# EasyEDA Pro project 电脑鼠_数字量最终方案.eprj, board PCB2
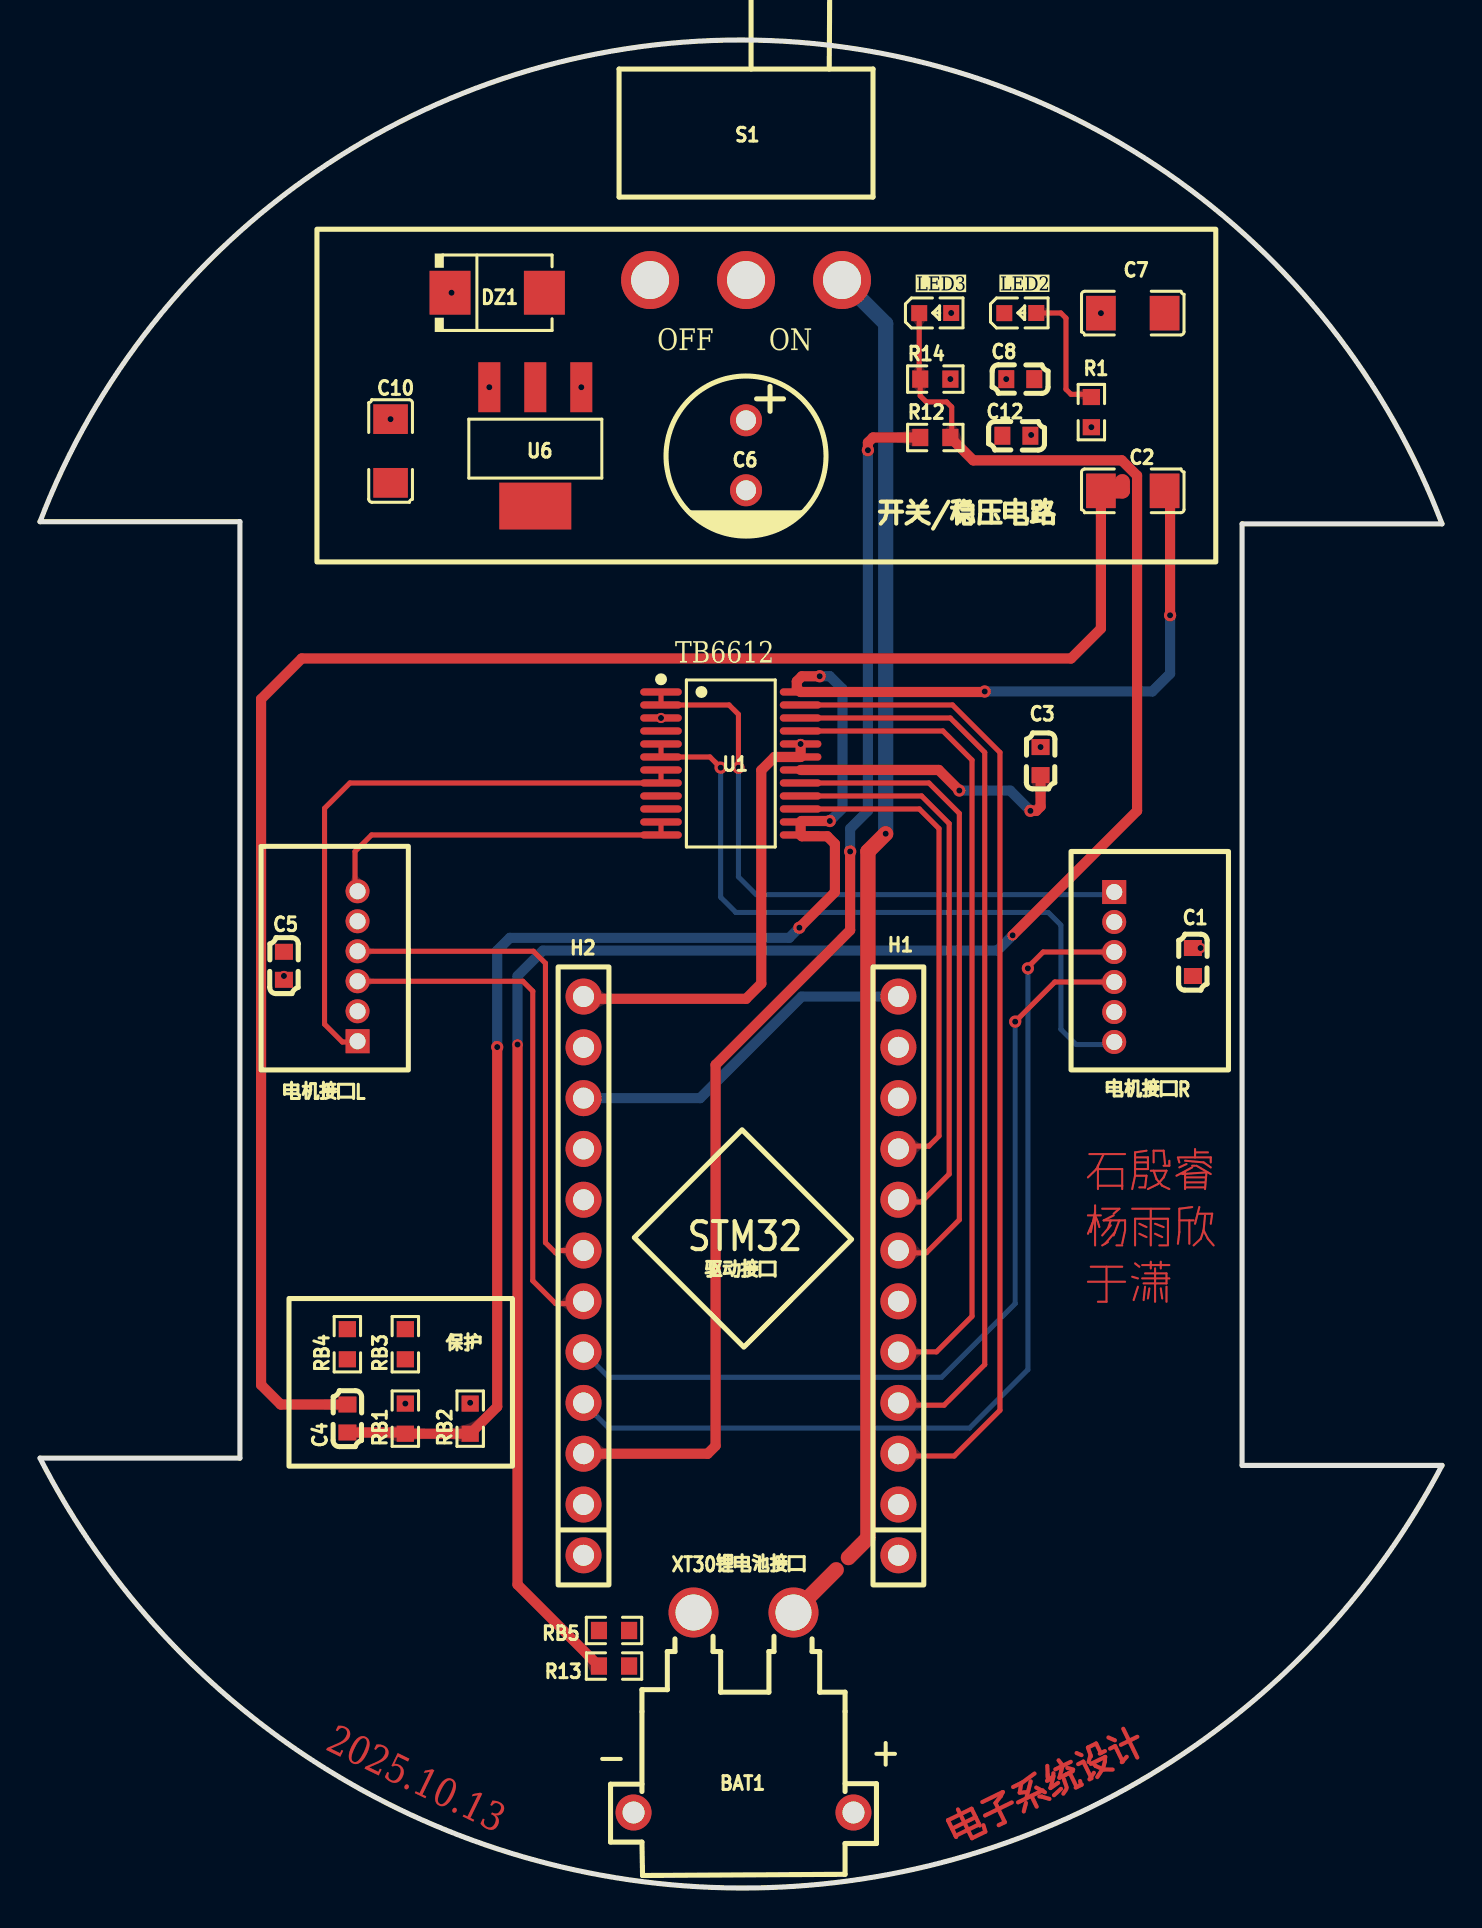
[diagram p4: board, top side]
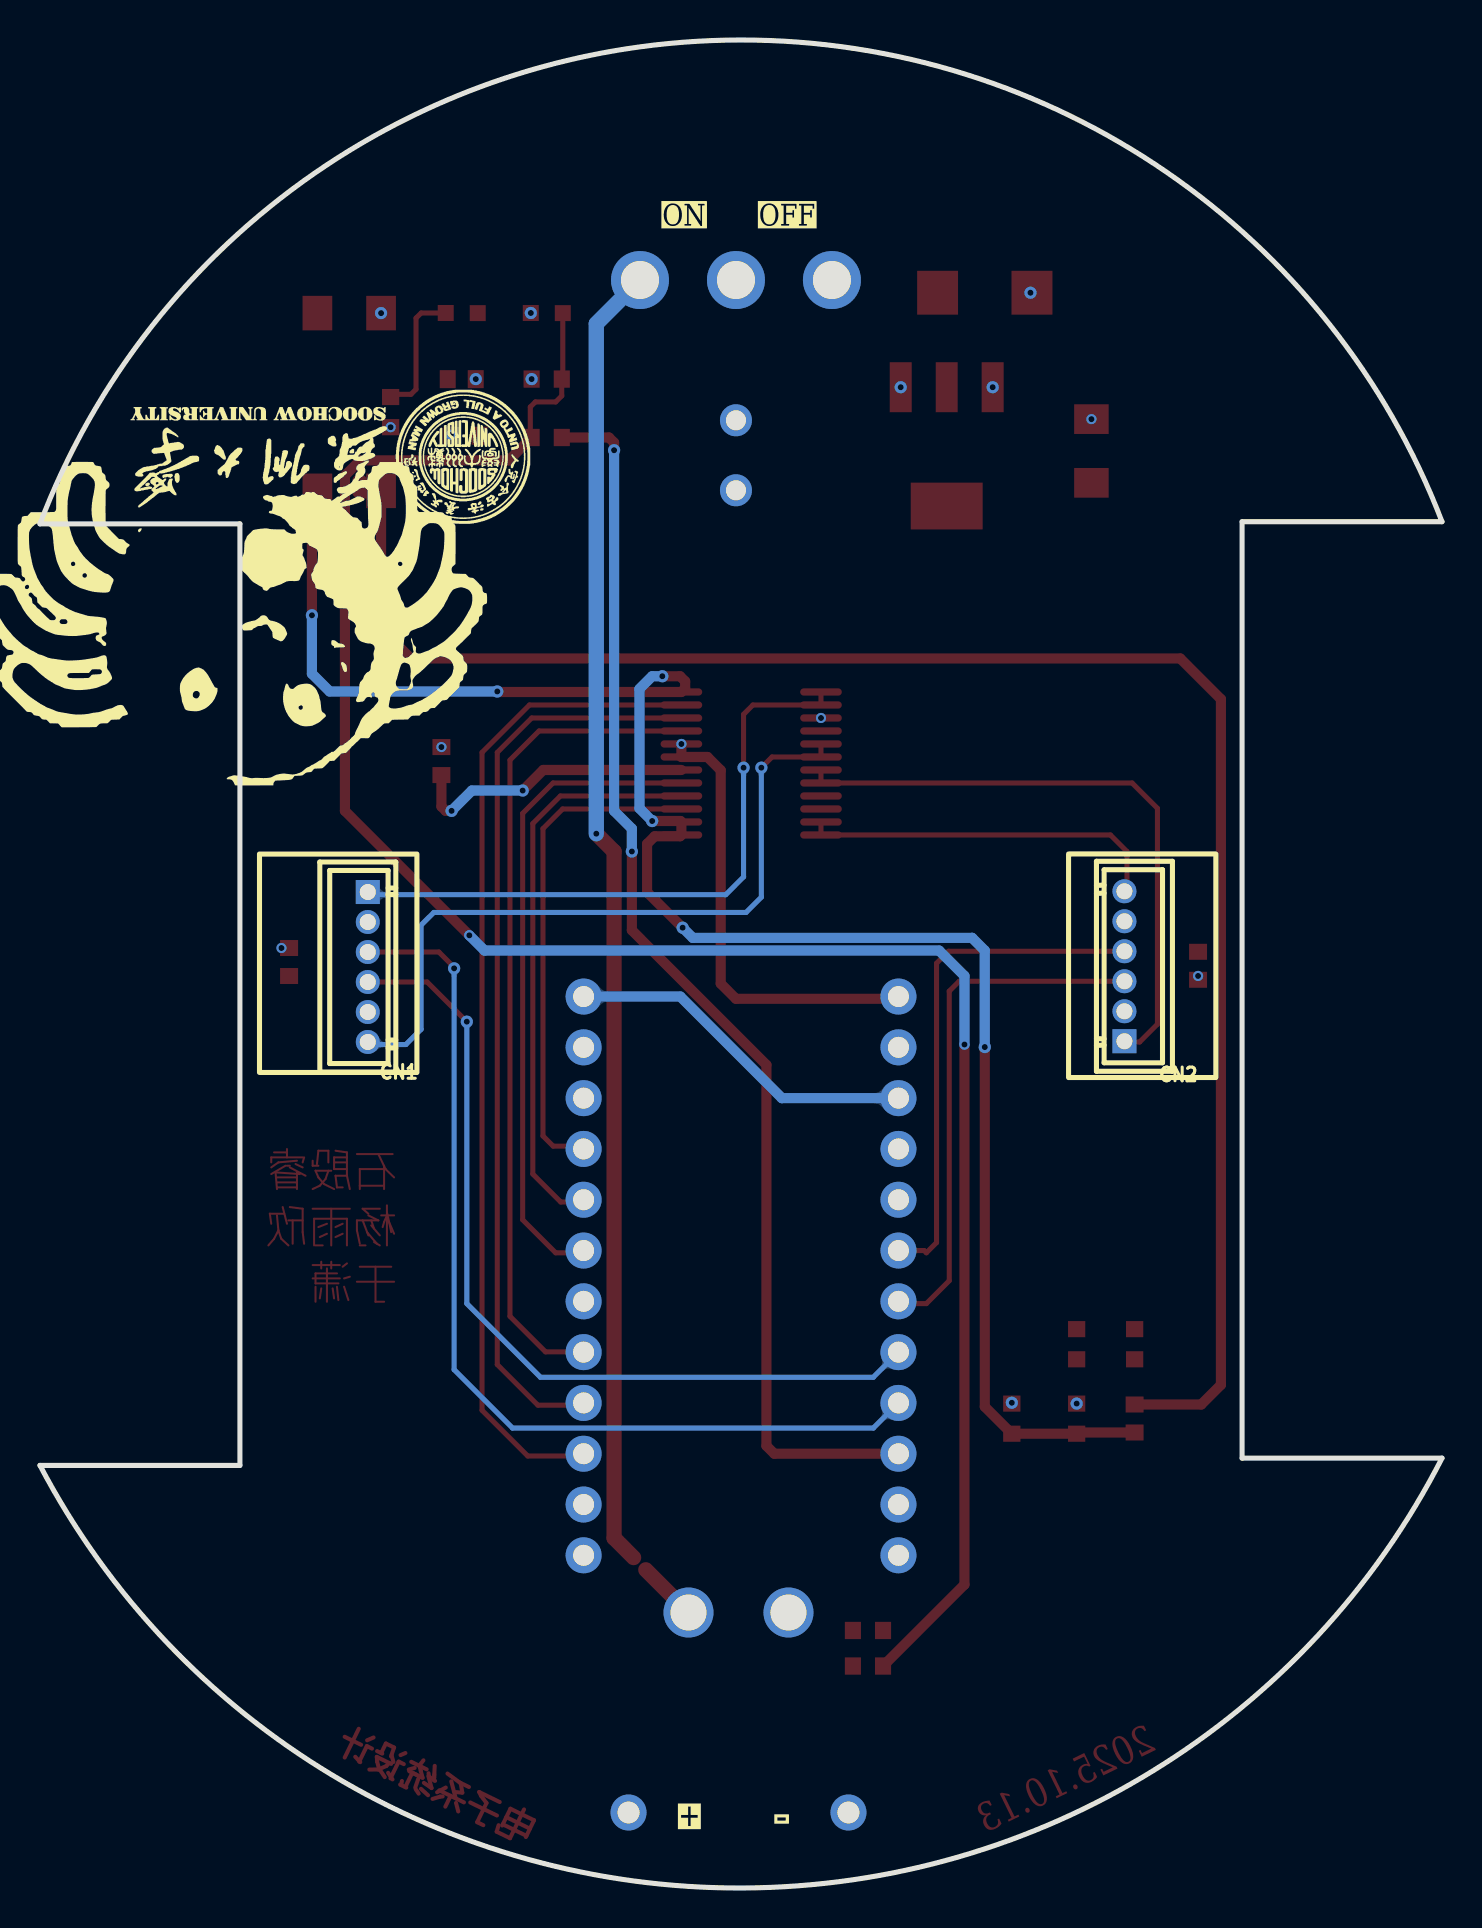
[diagram p5: board, bottom side, seen from below]

Outline 70.13 x 92.41 mm; copper layers: Top Layer, 7V4, +5V, Bottom Layer. Coordinates in mm from the lower left corner of the outline.
Outline path: 0,68.32 arc(35.1,92.41) 70.13,68.21 60.13,68.21 60.13,21.13 70.13,21.13 arc(34.95,0) 0,21.49 10,21.49 10,68.32 0,68.32
Stack: Top Layer 0.035mm 外层铜厚1oz / Dielectric1 0.2104mm 7628 RC49% 8.6mil / 7V4 0.0152mm 内层铜厚 / Dielectric2 1.065mm 1.1mm H/HOZ 含铜 / +5V 0.0152mm 内层铜厚 / Dielectric3 0.2104mm 7628 RC49% 8.6mil / Bottom Layer 0.035mm 外层铜厚1oz

## Design rules (mm)
template: JLCPCB Capability(Two Layers Board)
spacing copperThickness1oz (default): track to track 0.102, other pairs 0.152 to 0.3
spacing copperThickness2oz: track to track 0.203, other pairs 0.152 to 0.3
track width copperThickness1oz (default): min 0.127, default 0.254, max 2.54
track width copperThickness2oz: min 0.203, default 0.254, max 2.54
differential pair differentialPair (default): width min 0.127, default 0.254, max 2.54; gap min 0.152, default 0.152
via viaSize (default): diameter min 0.5, default 0.61, max 10; hole min 0.3, default 0.305, max 6.3

## Placement (name value [footprint] x y rotation side)
BAT1  XT30PW-M30.G.Y  [CONN-TH_XT30PW-M]  35.19 8.78 0 top
C1  100nF  [C0603]  57.67 46.3 90 top
C2  10uF  [C1206]  54.66 69.86 0 top
C3  100nF  [C0603]  50.05 56.35 270 top
C4  100nF  [C0603]  15.38 23.48 90 top
C5  100nF  [C0603]  12.2 46.11 270 top
C6  220uF  [CAP-TH_BD8.0-P3.50-D0.6-FD]  35.32 71.64 270 top
C7  10uF  [C1206]  54.66 78.75 180 top
C8  100nF  [C0603]  49.03 75.45 0 top
C10  10uF  [C1206]  17.54 71.86 90 top
C12  100nF  [C0603]  48.84 72.62 180 top
CN1  ZH1.5-6A  [CONN-TH_ZH1.5-6A]  53.73 46.05 270 bottom
CN2  ZH1.5-6A  [CONN-TH_ZH1.5-6A]  15.88 46.09 90 bottom
DZ1  SK106B  [SMB_L4.5-W3.7-LS5.4-RD]  22.87 79.77 0 top
H1  KH-2.54FH-1X12P-H8.5  [HDR-TH_12P-P2.54-V-F]  42.94 30.61 90 top
H2  KH-2.54FH-1X12P-H8.5  [HDR-TH_12P-P2.54-V-F]  27.19 30.61 90 top
LED2  XL-1608SURC-06  [LED0603-RD_RED]  49.03 78.75 0 top
LED3  XL-1608SURC-06  [LED0603-RD_RED]  44.78 78.75 0 top
R1  1kΩ  [R0603]  52.59 73.8 90 top
R12  2kΩ  [R0603]  44.78 72.53 0 top
R13  10kΩ  [R0603]  28.71 11.1 180 top
R14  null  [R0603]  44.78 75.45 0 top
RB1  0Ω  [R0603]  18.27 23.47 90 top
RB2  0Ω  [R0603]  21.52 23.47 90 top
RB3  0Ω  [R0603]  18.27 27.19 90 top
RB4  0Ω  [R0603]  15.37 27.19 90 top
RB5  0Ω  [R0603]  28.71 12.88 0 top
S1  SS12D10G5-WJ  [SW-TH_3P-SS12D06-1]  35.32 80.4 180 top
U1  TB6612FNG(O,C,8,EL  [SSOP-24_L8.4-W5.8-P0.65-LS7.8-BL]  34.55 56.23 270 top
U6  LM39100S-5.0  [SOT-223-3_L6.5-W3.4-P2.30-LS7.0-BR]  24.77 72.07 90 top

## Footprints (pads in the part's own frame, mm; a bottom-side part is the same pattern mirrored in y, then rotated)
C0603
  rect 0.8x0.9 smd: 1(-0.7,0) 2(0.7,0)
C1206
  rect 1.485x1.728 smd: 1(-1.593,0) 2(1.593,0)
CAP-TH_BD8.0-P3.50-D0.6-FD
  round 1.6 hole 1: 1(-1.75,0) 2(1.75,0)
CONN-TH_XT30PW-M
  round 2.5 hole 1.8: 1(-2.5,5) 2(2.5,5)
  round 1.8 hole 1.1: 3(5.5,-5) 4(-5.5,-5)
CONN-TH_ZH1.5-6A
  rect 1.2x1.2 hole 0.8: 1(-3.749,0)
  round 1.2 hole 0.8: 2(-2.251,0) 3(-0.75,0) 4(0.75,0) 5(2.251,0) 6(3.749,0)
HDR-TH_12P-P2.54-V-F
  round 1.8 hole 1.05: 1(-13.97,0) 2(-11.43,0) 3(-8.89,0) 4(-6.35,0) 5(-3.81,0) 6(-1.27,0) 7(1.27,0) 8(3.81,0) 9(6.35,0) 10(8.89,0) 11(11.43,0) 12(13.97,0)
LED0603-RD_RED
  rect 0.8x0.8 smd: 1(-0.799,-0.004) 2(0.799,0.004)
R0603
  rect 0.806x0.864 smd: 1(-0.753,0) 2(0.753,0)
SMB_L4.5-W3.7-LS5.4-RD
  rect 2.047x2.192 smd: 1(-2.361,0) 2(2.361,0)
SOT-223-3_L6.5-W3.4-P2.30-LS7.0-BR
  rect 2.5x1.1 smd: 1(2.97,-2.3) 2(2.97,0) 3(2.97,2.3)
  rect 2.34x3.6 smd: 4(-2.97,0)
SSOP-24_L8.4-W5.8-P0.65-LS7.8-BL
  oval 0.364x2.082 smd: 1(-3.575,-3.491) 2(-2.925,-3.491) 3(-2.275,-3.491) 4(-1.625,-3.491) 5(-0.975,-3.491) 6(-0.325,-3.491) 7(0.325,-3.491) 8(0.975,-3.491) 9(1.625,-3.491) 10(2.275,-3.491) 11(2.925,-3.491) 12(3.575,-3.491) 13(3.575,3.491) 14(2.925,3.491) 15(2.275,3.491) 16(1.625,3.491) 17(0.975,3.491) 18(0.325,3.491) 19(-0.325,3.491) 20(-0.975,3.491) 21(-1.625,3.491) 22(-2.275,3.491) 23(-2.925,3.491) 24(-3.575,3.491)
SW-TH_3P-SS12D06-1
  round 2.9 hole 1.9: 1(-4.8,0) 2(0,0) 3(4.8,0)

## Nets
As in the schematic, except:
GND: C1.1 C3.2 C5.1 C6.2 C7.1 C8.2 C10.1 C12.2 CN1.5 CN2.5 H1.1 H1.2 H1.6 H1.10 H1.11 H2.1 H2.2 H2.8 H2.9 LED2.1 RB3.1 RB3.2 RB4.1 RB4.2 RB5.1 U1.3 U1.4 U1.9 U1.10 U1.18 U6.2 U6.4
BGND: R13.1 RB5.2

Pads without a net: BAT1 1 2 3 4

## Via types
v1: diameter 0.61, hole 0.305, Top Layer to Bottom Layer, 24 vias
v2: diameter 0.508, hole 0.305, Top Layer to Bottom Layer, 10 vias

## Routing (per net, layer and track width the routed paths; a pad name or vN(x,y) marks a point on that pad's centre or on a via; arc(x,y) is an arc through that point)
3V3: length 17.9
  Bottom Layer w0.508: H1.12 38.1,44.58 33.02,39.5 H2.10
7V4: length 0
  Top Layer w0.508: v1(48.33,75.45) C8.1
  vias: v1(18.27,24.22) v1(20.58,79.77) v1(21.52,24.26) v1(27.07,75.04) v1(45.54,75.45) v1(45.58,78.76) v1(53.07,78.75)
+5V: length 22.9
  Top Layer w0.508: H2.12 27.3,44.46 35.32,44.46 36.08,45.22 36.08,55.89 36.74,56.55 U1.19 v2(38.04,57.2) ; v2(49.58,72.66) C12.1
  vias: v1(22.47,75.04) v2(12.2,45.61) v2(17.54,73.45) v2(50.05,57.05) v2(52.59,73.05) v2(58.05,47)
GND: length 14.5
  Top Layer w0.508: v1(45.98,54.88) 44.95,55.9 U1.18 ; C3.2 50.05,54.08 49.83,53.86 v1(49.54,53.86)
  Bottom Layer w0.508: v1(45.98,54.88) 48.52,54.88 v1(49.54,53.86)
  vias: v2(31.06,58.5)
PGND: length 90.9
  Top Layer w0.508: C4.2 12.04,24.18 11.06,25.16 11.06,59.45 13.09,61.48 51.57,61.48 53.07,62.97 C2.1
  Top Layer w0.762: 54.14,70.32 54.14,69.86 C2.1
(no net): length 3
  Top Layer w0.762: BAT1.2 39.82,15.91
BAT_ADC: length 62.8
  Top Layer w0.508: H2.3 33.4,21.72 33.79,22.11 33.79,41.16 40.52,47.89 v1(40.52,51.83) ; R12.1 41.67,72.53 41.41,72.28 v1(41.41,71.89)
  Bottom Layer w0.508: v1(41.41,71.89) 41.41,53.86 40.52,52.97 v1(40.52,51.83)
DIR_L1: length 41.4
  Top Layer w0.254: 42.94,26.8 42.95,26.81 44.84,26.81 46.62,28.59 46.62,56.4 45.16,57.85 U1.21
DIR_L2: length 45.7
  Top Layer w0.254: H1.4 43.05,24.14 45.22,24.14 47.25,26.17 47.25,56.78 45.53,58.5 U1.22
DIR_R1: length 32.7
  Top Layer w0.254: 42.94,31.88 43.05,31.76 44.33,31.76 45.98,33.41 45.98,53.73 44.46,55.25 U1.17
DIR_R2: length 28.7
  Top Layer w0.254: H1.8 43.05,34.3 44.08,34.3 45.48,35.7 45.48,53.23 44.1,54.6 U1.16
ENC_LA: length 43.5
  Top Layer w0.254: v1(48.78,43.32) 50.76,45.3 CN1.4
  Bottom Layer w0.254: 27.19,26.8 28.44,25.54 45.09,25.54 48.78,29.22 v1(48.78,43.32)
ENC_LB: length 48.7
  Top Layer w0.254: v1(49.41,45.99) 49.41,46.04 50.17,46.8 CN1.3
  Bottom Layer w0.254: v1(49.41,45.99) 49.41,25.92 46.49,23 28.44,23 H2.4
ENC_RA: length 25.8
  Top Layer w0.254: 27.19,31.88 25.9,31.88 25.79,31.76 25.28,32.27 25.28,46.24 24.68,46.84 CN2.4
ENC_RB: length 26.5
  Top Layer w0.254: H2.6 27.07,29.22 25.79,29.22 24.65,30.37 24.65,44.84 24.15,45.34 CN2.3
MOT_LA: length 32.1
  Top Layer w0.254: U1.1 U1.2 34.47,59.15 34.93,58.69 v1(34.93,56.02)
  Bottom Layer w0.254: v1(34.93,56.02) 34.93,50.56 35.82,49.67 53.6,49.67 CN1.1
MOT_LB: length 36.2
  Top Layer w0.254: U1.5 U1.6 33.51,56.55 v1(34.05,56.02)
  Bottom Layer w0.254: v1(34.05,56.02) 34.05,49.54 34.81,48.78 50.43,48.78 51.06,48.15 51.06,42.94 51.83,42.18 53.6,42.18 CN1.6
MOT_RA: length 30.8
  Top Layer w0.254: CN2.1 15.85,42.3 15.12,42.3 14.23,43.19 14.23,53.99 15.5,55.25 U1.8 U1.7
MOT_RB: length 18.3
  Top Layer w0.254: 15.88,49.84 15.76,49.97 15.76,51.83 16.58,52.65 U1.12 U1.11
PBAT: length 93.7
  Top Layer w0.508: v1(56.52,63.64) 56.52,69.59 C2.2 ; v1(39,60.59) 38.11,60.59 37.86,60.34 37.86,59.99 U1.24 47.23,59.8 v1(47.25,59.83) ; C4.1 18.21,22.78 RB1.1 RB2.1 22.87,24.07 v1(22.87,42.05) ; v1(39.51,53.35) 38.09,53.35 U1.14 U1.13 38.11,52.59 39.38,52.59 39.76,52.21 39.76,49.8 v1(37.98,48.02)
  Bottom Layer w0.508: v1(22.87,42.05) 22.87,46.88 23.5,47.51 37.47,47.51 v1(37.98,48.02) ; v1(56.52,63.64) 56.52,60.72 55.64,59.83 v1(47.25,59.83) ; v1(39,60.59) 39.51,60.59 40.14,59.96 40.14,53.99 v1(39.51,53.35)
PWM_L: length 49.9
  Top Layer w0.254: U1.23 45.64,59.15 48.02,56.78 48.02,23.89 45.73,21.6 43.05,21.6 H1.3
PWM_R: length 25
  Top Layer w0.254: 42.94,36.96 43.08,37.1 44.46,37.1 44.97,37.6 44.97,52.97 43.98,53.95 U1.15
$1N1559: length 65.6
  Top Layer w0.762: v1(42.3,52.72) 41.41,51.83 41.41,17.5 40.44,16.52
  Bottom Layer w0.762: S1.1 42.3,78.22 v1(42.3,52.72)
$1N1564: length 105
  Top Layer w0.254: R12.2 45.6,72.6 45.6,74.05 45.35,74.31 44.33,74.31 44.03,74.61 R14.1 43.98,75.5 LED3.1
  Top Layer w0.508: v2(48.65,47.64) 54.87,53.86 54.87,70.62 54.11,71.39 46.68,71.39 R12.2 ; v2(23.89,42.18) 23.89,15.17 R13.2
  Bottom Layer w0.508: v2(23.89,42.18) 23.89,45.61 25.16,46.88 47.89,46.88 v2(48.65,47.64)
$1N1618: length 6.6
  Top Layer w0.254: LED2.2 51.06,78.76 51.32,78.5 51.32,74.94 51.57,74.69 52.45,74.69 R1.2

## Copper pours and planes (outline as drawn; the poured copper is in the pictures)
7V4 on 7V4: -30.6,102.88 77.61,102.88 77.61,-5.45 -30.6,-5.45
+5V on +5V: -34.53,105.8 86.19,105.8 86.19,-8.24 -34.53,-8.24
GND on Top Layer: -17.14,98.31 82.31,98.31 82.31,-9 -17.14,-9
GND on Bottom Layer: -24.12,102.25 87.26,102.25 87.26,-8.24 -24.12,-8.24
BGND on Top Layer: 33.66,15.76 34.81,14.62 34.81,12.59 33.66,11.44 31.74,11.44 30.21,9.92 29.11,9.92 28.73,10.3 28.58,10.3 28.58,13.35 29.09,13.86 30.24,13.86 31.41,15.76
$1N1647 on Top Layer: 37.09,82.69 37.73,82.05 37.73,78.75 37.09,78.12 23.25,78.12 22.88,78.49 22.87,81.21 23.35,81.8 28.48,81.8 29.36,82.69

Small or netless copper shapes (teardrops, artwork), in the pictures only: 38 on Top Layer, 10 on Bottom Layer

## Text on the board
Bottom Silkscreen Layer: - | + | OFF | ON
Top Layer: 2025.10.13 | 电子系统设计 | 石殷睿 / 杨雨欣 / 于潇
Top Solder Mask Layer: 2025.10.13 | 电子系统设计 | 石殷睿 / 杨雨欣 / 于潇
Top Silkscreen Layer: STM32 | - | + | 保护 | 电机接口L | XT30锂电池接口 | 驱动接口 | 电机接口R | TB6612 | 开关/稳压电路 | OFF | ON
